# Altium schematic sheet 07_test6.SchDoc
size A3
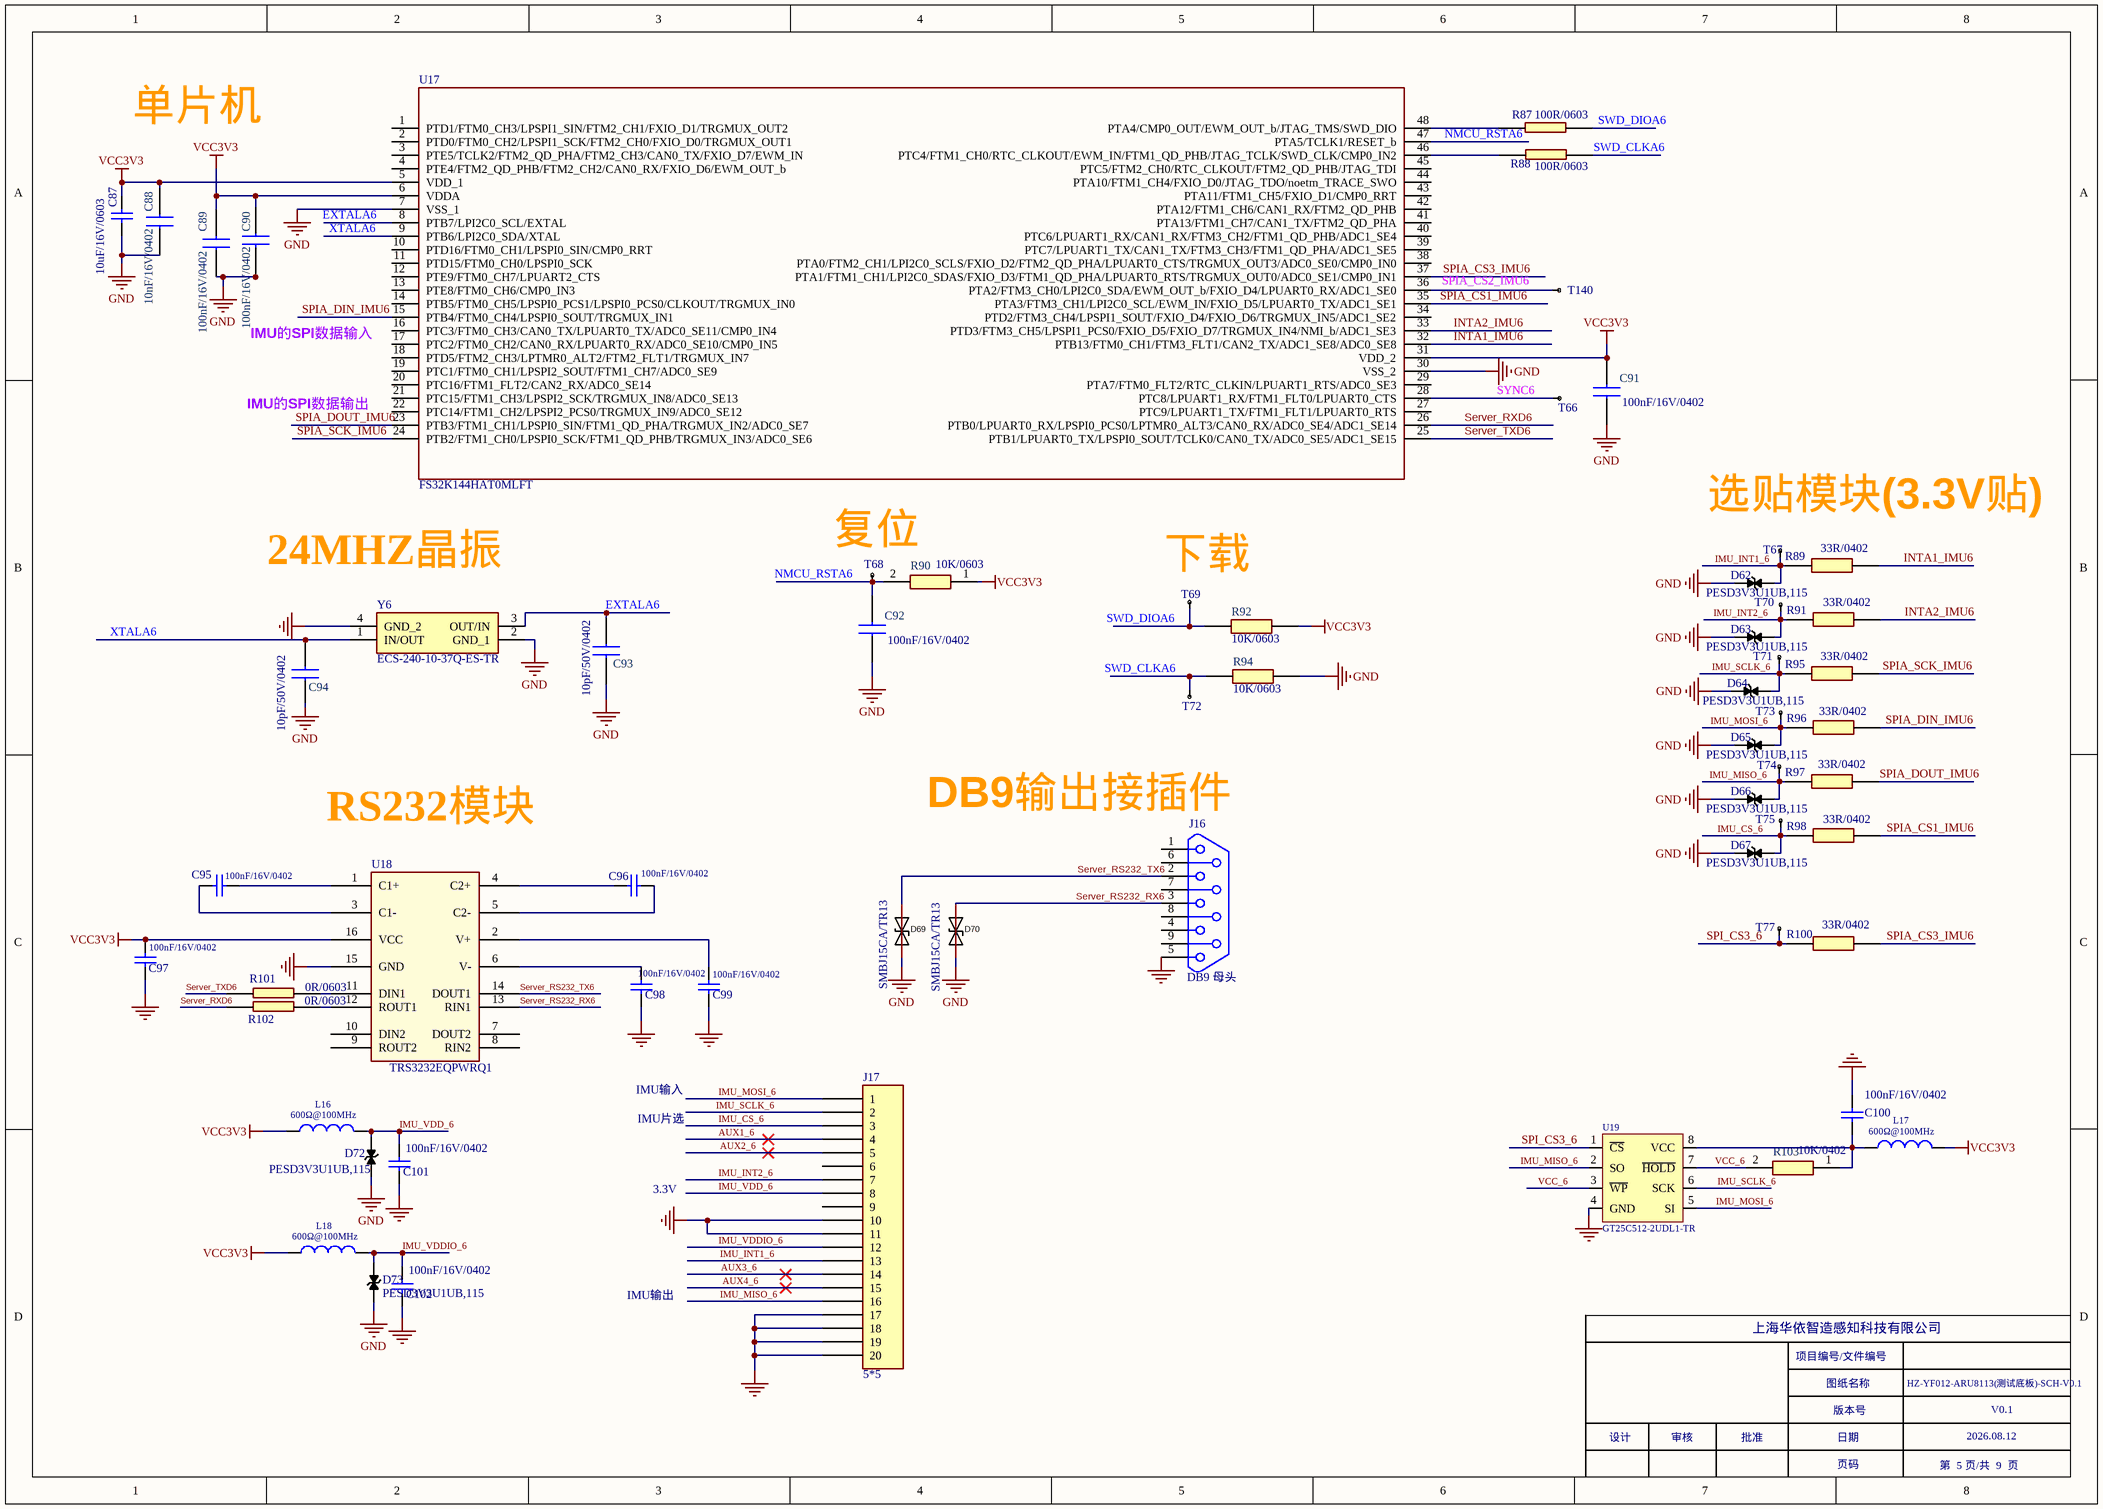
[diagram p0: 07_test6.SchDoc]

## Parts
C87  10uF/16V/0603  [C 0603_L]
C88  10nF/16V/0402  [C 0402_L]
C89  100nF/16V/0402  [C 0402_L]
C90  100nF/16V/0402  [C 0402_L]
C91  100nF/16V/0402  [C 0402_L]
C92  100nF/16V/0402  [C 0402_L]
C93  10pF/50V/0402  [C 0402_L]
C94  10pF/50V/0402  [C 0402_L]
C95  value 100nF/16V/0402  [C 0402_L]  (hidden comment: Cap)
C96  value 100nF/16V/0402  [C 0402_L]  (hidden comment: Cap)
C97  value 100nF/16V/0402  [C 0402_L]  (hidden comment: Cap)
C98  value 100nF/16V/0402  [C 0402_L]  (hidden comment: Cap)
C99  value 100nF/16V/0402  [C 0402_L]  (hidden comment: Cap)
C100  100nF/16V/0402  [C 0402_L]
C101  100nF/16V/0402  [0402C]
C102  100nF/16V/0402  [0402C]
D62  PESD3V3U1UB,115  [SOD-523]
D63  PESD3V3U1UB,115  [SOD-523]
D64  PESD3V3U1UB,115  [SOD-523]
D65  PESD3V3U1UB,115  [SOD-523]
D66  PESD3V3U1UB,115  [SOD-523]
D67  PESD3V3U1UB,115  [SOD-523]
D69  SMBJ15CA/TR13  [SMB]
D70  SMBJ15CA/TR13  [SMB]
D72  PESD3V3U1UB,115  [PESD3V3U1UB,115]
D73  PESD3V3U1UB,115  [PESD3V3U1UB,115]
J16  DB9 母头  [DB9-RS8R1-2R77]
J17  5*5  [5*5-socket]
L16  value 600Ω@100MHz  [0603L]  (hidden comment: Inductor)
L17  value 600Ω@100MHz  [0603L]  (hidden comment: Inductor)
L18  value 600Ω@100MHz  [0603L]  (hidden comment: Inductor)
R87  100R/0603  [R 0603_L]
R88  100R/0603  [R 0603_L]
R89  33R/0402  [0402R]
R90  10K/0603  [R 0603_L]
R91  33R/0402  [0402R]
R92  10K/0603  [R 0603_L]
R94  10K/0603  [R 0603_L]
R95  33R/0402  [0402R]
R96  33R/0402  [0402R]
R97  33R/0402  [0402R]
R98  33R/0402  [0402R]
R100  33R/0402  [0402R]
R101  0R/0603  [R 0603_L]
R102  0R/0603  [R 0603_L]
R103  10K/0402  [0402R]
T66  TEST  [Test-0.5mm]  (value not drawn)
T67  TEST  [TEST]  (value not drawn)
T68  TEST  [TEST]  (value not drawn)
T69  TEST  [TEST]  (value not drawn)
T70  TEST  [TEST]  (value not drawn)
T71  TEST  [TEST]  (value not drawn)
T72  TEST  [TEST]  (value not drawn)
T73  TEST  [TEST]  (value not drawn)
T74  TEST  [TEST]  (value not drawn)
T75  TEST  [TEST]  (value not drawn)
T77  TEST  [TEST]  (value not drawn)
T140  TEST  [Test-0.5mm]  (value not drawn)
U17  FS32K144HAT0MLFT  [LQFP48_7X7]
U18  TRS3232EQPWRQ1  [TSSOP16_640X500]
U19  GT25C512-2UDL1-TR  [GT25C512-2UDLA2-TR]
Y6  ECS-240-10-37Q-ES-TR  [ECS2401037QESTR]

## Nets
GND: C87.2 C88.1 C89.2 C90.2 C91.2 C92.2 C93.1 C94.1 C97.2 C98.2 C99.2 C100.1 C101.2 C102.2 D62.1 D63.1 D64.1 D65.1 D66.1 D67.1 D69.1 D70.1 D72.1 D73.1 J16.5 J17.10 J17.11 J17.17 J17.18 J17.19 J17.20 R94.1 U17.7(VSS_1) U17.30(VSS_2) U18.15(GND) U19.4(GND) Y6.2(GND_1) Y6.4(GND_2)
VCC3V3: C87.1 C88.2 C89.1 C90.1 C91.1 C97.1 L16.1 L17.2 L18.1 R90.1 R92.1 U17.5(VDD_1) U17.6(VDDA) U17.31(VDD_2) U18.16(VCC)
AUX1_6: J17.4
AUX2_6: J17.5
AUX3_6: J17.14
AUX4_6: J17.15
EXTALA6: C93.2 U17.8(PTB7/LPI2C0_SCL/EXTAL) Y6.3(OUT/IN)
IMU_CS_6: D67.2 J17.3 R98.2 T75.1
IMU_INT1_6: D62.2 J17.13 R89.2 T67.1
IMU_INT2_6: D63.2 J17.7 R91.2 T70.1
IMU_MISO_6: D66.2 J17.16 R97.2 T74.1 U19.2(SO)
IMU_MOSI_6: D65.2 J17.1 R96.2 T73.1 U19.5(SI)
IMU_SCLK_6: D64.2 J17.2 R95.2 T71.1 U19.6(SCK)
IMU_VDD_6: C101.1 D72.2 J17.8 L16.2
IMU_VDDIO_6: C102.1 D73.2 J17.12 L18.2
INTA1_IMU6: R89.1 U17.32(PTB13/FTM0_CH1/FTM3_FLT1/CAN2_TX/ADC1_SE8/ADC0_SE8)
INTA2_IMU6: R91.1 U17.33(PTD3/FTM3_CH5/LPSPI1_PCS0/FXIO_D5/FXIO_D7/TRGMUX_IN4/NMI_b/ADC1_SE3)
NMCU_RSTA6: C92.1 R90.2 T68.1 U17.47(PTA5/TCLK1/RESET_b)
Server_RS232_RX6: D70.2 J16.3 U18.13(RIN1)
Server_RS232_TX6: D69.2 J16.2 U18.14(DOUT1)
Server_RXD6: R102.1 U17.26(PTB0/LPUART0_RX/LPSPI0_PCS0/LPTMR0_ALT3/CAN0_RX/ADC0_SE4/ADC1_SE14)
Server_TXD6: R101.1 U17.25(PTB1/LPUART0_TX/LPSPI0_SOUT/TCLK0/CAN0_TX/ADC0_SE5/ADC1_SE15)
SPI_CS3_6: R100.2 T77.1 U19.1(~{CS})
SPIA_CS1_IMU6: R98.1 U17.35(PTA3/FTM3_CH1/LPI2C0_SCL/EWM_IN/FXIO_D5/LPUART0_TX/ADC1_SE1)
SPIA_CS3_IMU6: R100.1 U17.37(PTA1/FTM1_CH1/LPI2C0_SDAS/FXIO_D3/FTM1_QD_PHA/LPUART0_RTS/TRGMUX_OUT0/ADC0_SE1/CMP0_IN1)
SPIA_DIN_IMU6: R96.1 U17.15(PTB4/FTM0_CH4/LPSPI0_SOUT/TRGMUX_IN1)
SPIA_DOUT_IMU6: R97.1 U17.23(PTB3/FTM1_CH1/LPSPI0_SIN/FTM1_QD_PHA/TRGMUX_IN2/ADC0_SE7)
SPIA_SCK_IMU6: R95.1 U17.24(PTB2/FTM1_CH0/LPSPI0_SCK/FTM1_QD_PHB/TRGMUX_IN3/ADC0_SE6)
SWD_CLKA6: R88.2 R94.2 T72.1
SWD_DIOA6: R87.2 R92.2 T69.1
SYNC6: T66.1 U17.28(PTC8/LPUART1_RX/FTM1_FLT0/LPUART0_CTS)
VCC_6: R103.2 U19.3(~{WP}) U19.7(~{HOLD})
XTALA6: C94.2 U17.9(PTB6/LPI2C0_SDA/XTAL) Y6.1(IN/OUT)
NetC95_1: C95.1 U18.3(C1-)
NetC95_2: C95.2 U18.1(C1+)
NetC96_1: C96.1 U18.4(C2+)
NetC96_2: C96.2 U18.5(C2-)
NetC98_1: C98.1 U18.6(V-)
NetC99_1: C99.1 U18.2(V+)
NetC100_2: C100.2 L17.1 R103.1 U19.8(VCC)
NetR87_1: R87.1 U17.48(PTA4/CMP0_OUT/EWM_OUT_b/JTAG_TMS/SWD_DIO)
NetR88_1: R88.1 U17.46(PTC4/FTM1_CH0/RTC_CLKOUT/EWM_IN/FTM1_QD_PHB/JTAG_TCLK/SWD_CLK/CMP0_IN2)
NetR101_2: R101.2 U18.11(DIN1)
NetR102_2: R102.2 U18.12(ROUT1)
NetT140_1: T140.1 U17.36(PTA2/FTM3_CH0/LPI2C0_SDA/EWM_OUT_b/FXIO_D4/LPUART0_RX/ADC1_SE0)

Not connected (* = marked no-connect by the designer): J16 1 4 6 7 8 9; J17 6 9; U17 1(PTD1/FTM0_CH3/LPSPI1_SIN/FTM2_CH1/FXIO_D1/TRGMUX_OUT2) 2(PTD0/FTM0_CH2/LPSPI1_SCK/FTM2_CH0/FXIO_D0/TRGMUX_OUT1) 3(PTE5/TCLK2/FTM2_QD_PHA/FTM2_CH3/CAN0_TX/FXIO_D7/EWM_IN) 4(PTE4/FTM2_QD_PHB/FTM2_CH2/CAN0_RX/FXIO_D6/EWM_OUT_b) 10(PTD16/FTM0_CH1/LPSPI0_SIN/CMP0_RRT) 11(PTD15/FTM0_CH0/LPSPI0_SCK) 12(PTE9/FTM0_CH7/LPUART2_CTS) 13(PTE8/FTM0_CH6/CMP0_IN3) 14(PTB5/FTM0_CH5/LPSPI0_PCS1/LPSPI0_PCS0/CLKOUT/TRGMUX_IN0) 16(PTC3/FTM0_CH3/CAN0_TX/LPUART0_TX/ADC0_SE11/CMP0_IN4) 17(PTC2/FTM0_CH2/CAN0_RX/LPUART0_RX/ADC0_SE10/CMP0_IN5) 18(PTD5/FTM2_CH3/LPTMR0_ALT2/FTM2_FLT1/TRGMUX_IN7) 19(PTC1/FTM0_CH1/LPSPI2_SOUT/FTM1_CH7/ADC0_SE9) 20(PTC16/FTM1_FLT2/CAN2_RX/ADC0_SE14) 21(PTC15/FTM1_CH3/LPSPI2_SCK/TRGMUX_IN8/ADC0_SE13) 22(PTC14/FTM1_CH2/LPSPI2_PCS0/TRGMUX_IN9/ADC0_SE12) 27(PTC9/LPUART1_TX/FTM1_FLT1/LPUART0_RTS) 29(PTA7/FTM0_FLT2/RTC_CLKIN/LPUART1_RTS/ADC0_SE3) 34(PTD2/FTM3_CH4/LPSPI1_SOUT/FXIO_D4/FXIO_D6/TRGMUX_IN5/ADC1_SE2) 38(PTA0/FTM2_CH1/LPI2C0_SCLS/FXIO_D2/FTM2_QD_PHA/LPUART0_CTS/TRGMUX_OUT3/ADC0_SE0/CMP0_IN0) 39(PTC7/LPUART1_TX/CAN1_TX/FTM3_CH3/FTM1_QD_PHA/ADC1_SE5) 40(PTC6/LPUART1_RX/CAN1_RX/FTM3_CH2/FTM1_QD_PHB/ADC1_SE4) 41(PTA13/FTM1_CH7/CAN1_TX/FTM2_QD_PHA) 42(PTA12/FTM1_CH6/CAN1_RX/FTM2_QD_PHB) 43(PTA11/FTM1_CH5/FXIO_D1/CMP0_RRT) 44(PTA10/FTM1_CH4/FXIO_D0/JTAG_TDO/noetm_TRACE_SWO) 45(PTC5/FTM2_CH0/RTC_CLKOUT/FTM2_QD_PHB/JTAG_TDI); U18 7(DOUT2) 8(RIN2) 9(ROUT2) 10(DIN2)

## Notes on the sheet
- 单片机
- IMU的SPI数据输入
- IMU的SPI数据输出
- 选贴模块(3.3V贴)
- (near Y6) 24MHZ晶振
- (near T68) 复位
- (near T69) 下载
- (near U18) RS232模块
- DB9输出接插件
- IMU输入
- IMU片选
- 3.3V
- IMU输出
- 上海华依智造感知科技有限公司
- 项目编号/文件编号
- 图纸名称
- HZ-YF012-ARU8113(测试底板)-SCH-V0.1
- 设计
- 审核
- 批准
- 版本号
- 日期
- 2026.08.12
- V0.1
- 页码
- 第  5 页/共  9  页
- Labels drawn without touching a wire or pin: SPIA_CS2_IMU6

## Library data of the parts
C87 = Cap: SMD/SMT 10UF 16V 20% 0603; Published: 8-Jun-2000; LatestRevisionDate: 17-Jul-2002; LatestRevisionNote: Re-released for DXP Platform.; PackageReference: RAD-0.3; Publisher: Altium Limited; PackageDescription: Radial Cap, Thru-Hole; 2 Leads; 0.3 in Pin Spacing; Value: 10uF/16V
C88-C94 = 0402Capacitor: Capacitor; Manufacturer_Name: Murata Electronics; Manufacturer_Part_Number: GCM155R71C104KA55D; Datasheet Link: https://componentsearchengine.com//GCM155R71C104KA55D.pdf; Height: 0.55mm; Mouser2 Part Number: 81-GCM155R71C104KA5D; Mouser2 Price/Stock: https://www.mouser.com/Search/Refine.aspx?Keyword=81-GCM155R71C104KA5D
C95-C102 = Cap: '100nF/16V/10%/ 0402/X7R / -55℃ ～ 125℃/AEC-Q200; Published: 8-Jun-2000; LatestRevisionDate: 17-Jul-2002; LatestRevisionNote: Re-released for DXP Platform.; PackageReference: RAD-0.3; Publisher: Altium Limited; PackageDescription: Radial Cap, Thru-Hole; 2 Leads; 0.3 in Pin Spacing
  C100-C102: Value: 100nF/16V/0402
D62-D67 D72 D73 = SMBJ36CA: 双向TVS管；600W表面贴装瞬态电压抑制器,工作电压36V，SMB_DO-214AA封装 DIODES
D69 D70 = SMBJ15CA/TR13_C78410: Manufacturer: Brightking(君耀电子); Symbol: SMBJ15CA-C78410; Add into BOM: yes; polarity: 双向; Reverse Stand-Off Voltage (Vrwm): 15V; Maximum Clamping Voltage: 24.4V; Peak Pulse Current (Ipp)@10/1000us: 24.6A; Peak Pulse Power Dissipation (Ppp)@10/1000us: 600W; Breakdown Voltage: 16.7V; Type: TVS; Device: SMBJ15CA/TR13_C78410; LCSC Part Name: 双向 15V截止 24.6A峰值脉冲; Supplier Part: C78410; Manufacturer Part: SMBJ15CA/TR13; Supplier Footprint: SMB(DO-214AA); JLCPCB Part Class: Extended Part; Datasheet: https://atta.szlcsc.com/upload/public/pdf/source/20181127/C309995_EB3DFB9F9AEE5D2146ECD9FA5992A402.pdf; Supplier: LCSC; Convert to PCB: yes
J16 = DB9
L16-L18 = Inductor: Code_IEC: 1005; Published: 8-Jun-2000; LatestRevisionDate: 29-May-2009; LatestRevisionNote: IPC-7351 Footprint Added.; PackageReference: 0402-A; Publisher: Altium Limited; PackageDescription: Chip Inductor; Code_JEITA: 0402
R87 R88 R101 R102 = 0402
R89-R92 R94-R98 R100 R103 = 0402Resistor: Resistor; Manufacturer_Name: KOA Speer; Manufacturer_Part_Number: RN73H1ETTP1002F50; Datasheet Link: https://www.mouser.fr/datasheet/2/219/RN73H-12200.pdf; Height: 0.4mm
U17 = FS32K144HAT0MLFT: Integrated Circuit; Manufacturer_Name: NXP; Datasheet Link: http://www.nxp.com/docs/en/data-sheet/S32K-DS.pdf; Height: 1.6mm; Manufacturer_Part_Number: FS32K144HAT0MLFT
U19 = GT25C512-2UDLA2-TR
Y6 = ECS-240-10-37Q-ES-TR: Crystal or Oscillator; Manufacturer_Name: ECS; Datasheet Link: https://www.ecsxtal.com/store/pdf/ECX-1637Q.pdf; Height: 0.55mm; Manufacturer_Part_Number: ECS-240-10-37Q-ES-TR